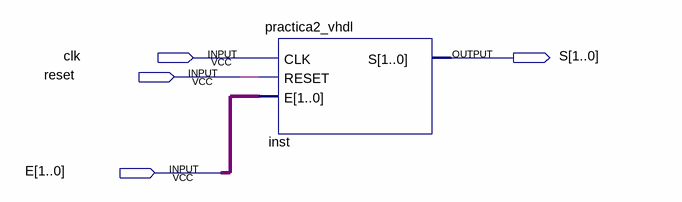
[diagram p0: schematic sheet]
// Quartus schematic P2_2 (1).bdf as structural Verilog: 1 symbols, 4 pins
module \P2_2_(1)  (
  input  clk,
  input  reset,
  input  [1:0] E,
  output [1:0] S
);

  practica2_vhdl inst (.CLK(clk), .RESET(reset), .E(E), .S(S));
endmodule
